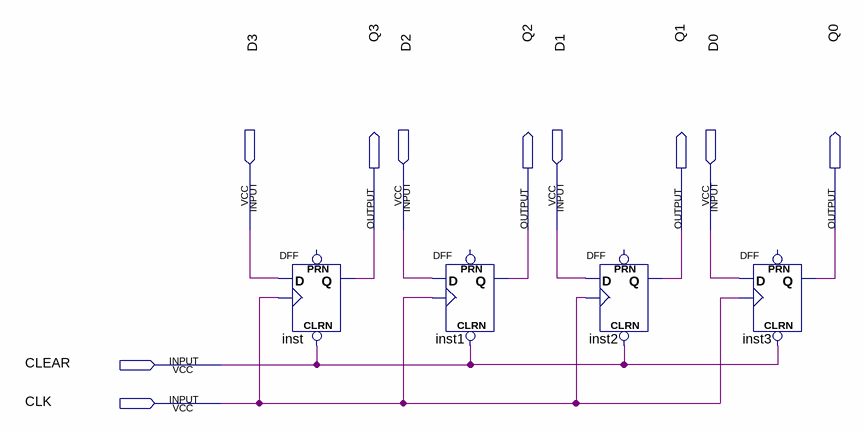
[diagram p0: schematic sheet]
// Quartus schematic register4bit.bdf as structural Verilog: 4 symbols, 10 pins
module register4bit (
  input  D3,
  input  D2,
  input  D1,
  input  D0,
  input  CLEAR,
  input  CLK,
  output Q3,
  output Q2,
  output Q1,
  output Q0
);

  DFF inst (.CLRN(CLEAR), .CLK(CLK), .D(D3), .Q(Q3));  // open: PRN
  DFF inst1 (.CLRN(CLEAR), .CLK(CLK), .D(D2), .Q(Q2));  // open: PRN
  DFF inst2 (.CLRN(CLEAR), .CLK(CLK), .D(D1), .Q(Q1));  // open: PRN
  DFF inst3 (.CLRN(CLEAR), .CLK(CLK), .D(D0), .Q(Q0));  // open: PRN
endmodule
